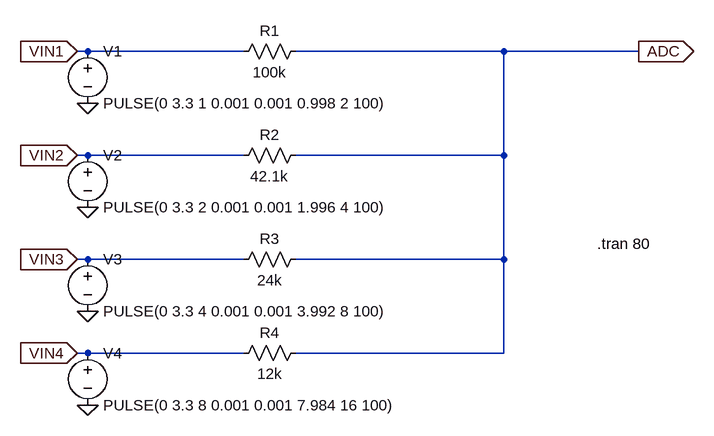
[diagram p0: schematic ADC_Analysis.asc]
ADC_Analysis.asc, the LTspice schematic file:
Version 4.1
SHEET 1 1124 712
WIRE -96 144 -112 144
WIRE 144 144 -96 144
WIRE 544 144 224 144
WIRE 752 144 544 144
WIRE -96 304 -112 304
WIRE 144 304 -96 304
WIRE 544 304 544 144
WIRE 544 304 224 304
WIRE -96 464 -112 464
WIRE 144 464 -96 464
WIRE 544 464 544 304
WIRE 544 464 224 464
WIRE -96 608 -112 608
WIRE 144 608 -96 608
WIRE 544 608 544 464
WIRE 544 608 224 608
FLAG -112 144 VIN1
IOPIN -112 144 In
FLAG -112 304 VIN2
IOPIN -112 304 In
FLAG -112 464 VIN3
IOPIN -112 464 In
FLAG -112 608 VIN4
IOPIN -112 608 In
FLAG 752 144 ADC
IOPIN 752 144 Out
FLAG -96 544 0
FLAG -96 384 0
FLAG -96 224 0
FLAG -96 688 0
SYMBOL res 240 128 R90
WINDOW 0 0 56 VBottom 2
WINDOW 3 32 56 VTop 2
SYMATTR InstName R1
SYMATTR Value 100k
SYMBOL res 240 288 R90
WINDOW 0 0 56 VBottom 2
WINDOW 3 32 56 VTop 2
SYMATTR InstName R2
SYMATTR Value 42.1k
SYMBOL res 240 448 R90
WINDOW 0 0 56 VBottom 2
WINDOW 3 32 56 VTop 2
SYMATTR InstName R3
SYMATTR Value 24k
SYMBOL res 240 592 R90
WINDOW 0 0 56 VBottom 2
WINDOW 3 32 56 VTop 2
SYMATTR InstName R4
SYMATTR Value 12k
SYMBOL voltage -96 128 R0
WINDOW 123 0 0 Left 0
WINDOW 39 0 0 Left 0
SYMATTR InstName V1
SYMATTR Value PULSE(0 3.3 1 0.001 0.001 0.998 2 100)
SYMBOL voltage -96 288 R0
WINDOW 123 0 0 Left 0
WINDOW 39 0 0 Left 0
SYMATTR InstName V2
SYMATTR Value PULSE(0 3.3 2 0.001 0.001 1.996 4 100)
SYMBOL voltage -96 448 R0
WINDOW 123 0 0 Left 0
WINDOW 39 0 0 Left 0
SYMATTR InstName V3
SYMATTR Value PULSE(0 3.3 4 0.001 0.001 3.992 8 100)
SYMBOL voltage -96 592 R0
WINDOW 123 0 0 Left 0
WINDOW 39 0 0 Left 0
SYMATTR InstName V4
SYMATTR Value PULSE(0 3.3 8 0.001 0.001 7.984 16 100)
TEXT 688 440 Left 2 !.tran 80

The netlist it stands for:
* ADC_Analysis.asc
R1 ADC VIN1 100k
R2 ADC VIN2 42.1k
R3 ADC VIN3 24k
R4 ADC VIN4 12k
V1 VIN1 0 PULSE(0 3.3 1 0.001 0.001 0.998 2 100)
V2 VIN2 0 PULSE(0 3.3 2 0.001 0.001 1.996 4 100)
V3 VIN3 0 PULSE(0 3.3 4 0.001 0.001 3.992 8 100)
V4 VIN4 0 PULSE(0 3.3 8 0.001 0.001 7.984 16 100)
.tran 80
.backanno
.end

* Results of the author's LTspice run, read from the files saved beside the schematic
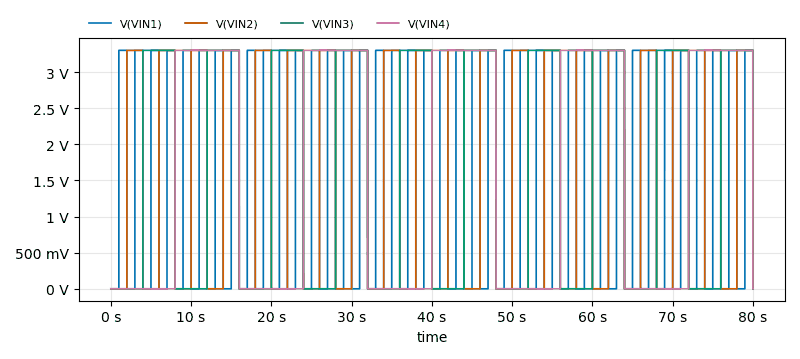
[diagram p1: Transient Analysis of ADC_Analysis.asc, plotted from the saved traces]
* Transient Analysis, 1 run:
*   V(VIN1): min 0 V, max 3.3 V, average 1.648 V, rms 2.332 V, last 0 V
*   V(VIN2): min 0 V, max 3.3 V, average 1.648 V, rms 2.332 V, last 0 V
*   V(VIN3): min 0 V, max 3.3 V, average 1.647 V, rms 2.331 V, last 0 V
*   V(VIN4): min 0 V, max 3.3 V, average 1.647 V, rms 2.331 V, last 0 V